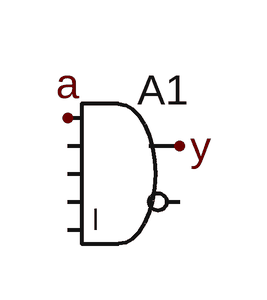
[diagram p0: schematic adevice_open_pin_stock_and.asc]
adevice_open_pin_stock_and.asc, the LTspice schematic file:
Version 4
SHEET 1 880 680
FLAG 64 96 a
FLAG 128 112 y
SYMBOL Digital\and 96 64 R0
SYMATTR InstName A1

The netlist it stands for:
* adevice_open_pin_stock_and.asc
A1 a 0 0 0 0 0 y 0 AND
.backanno
.end